# EasyEDA Pro project ProPrj_装配机器人（更新后）_2025-04-30.epro

# Schematic Schematic1
Board Name: Board1; Create Date: 2024-05-07; Page Name: P1; Project Name: 装配机器人（更新后）; Schematic Name: Schematic1; Update Date: 2025-04-26; Company: 嘉立创EDA; Page Size: A4; Version: V1.0
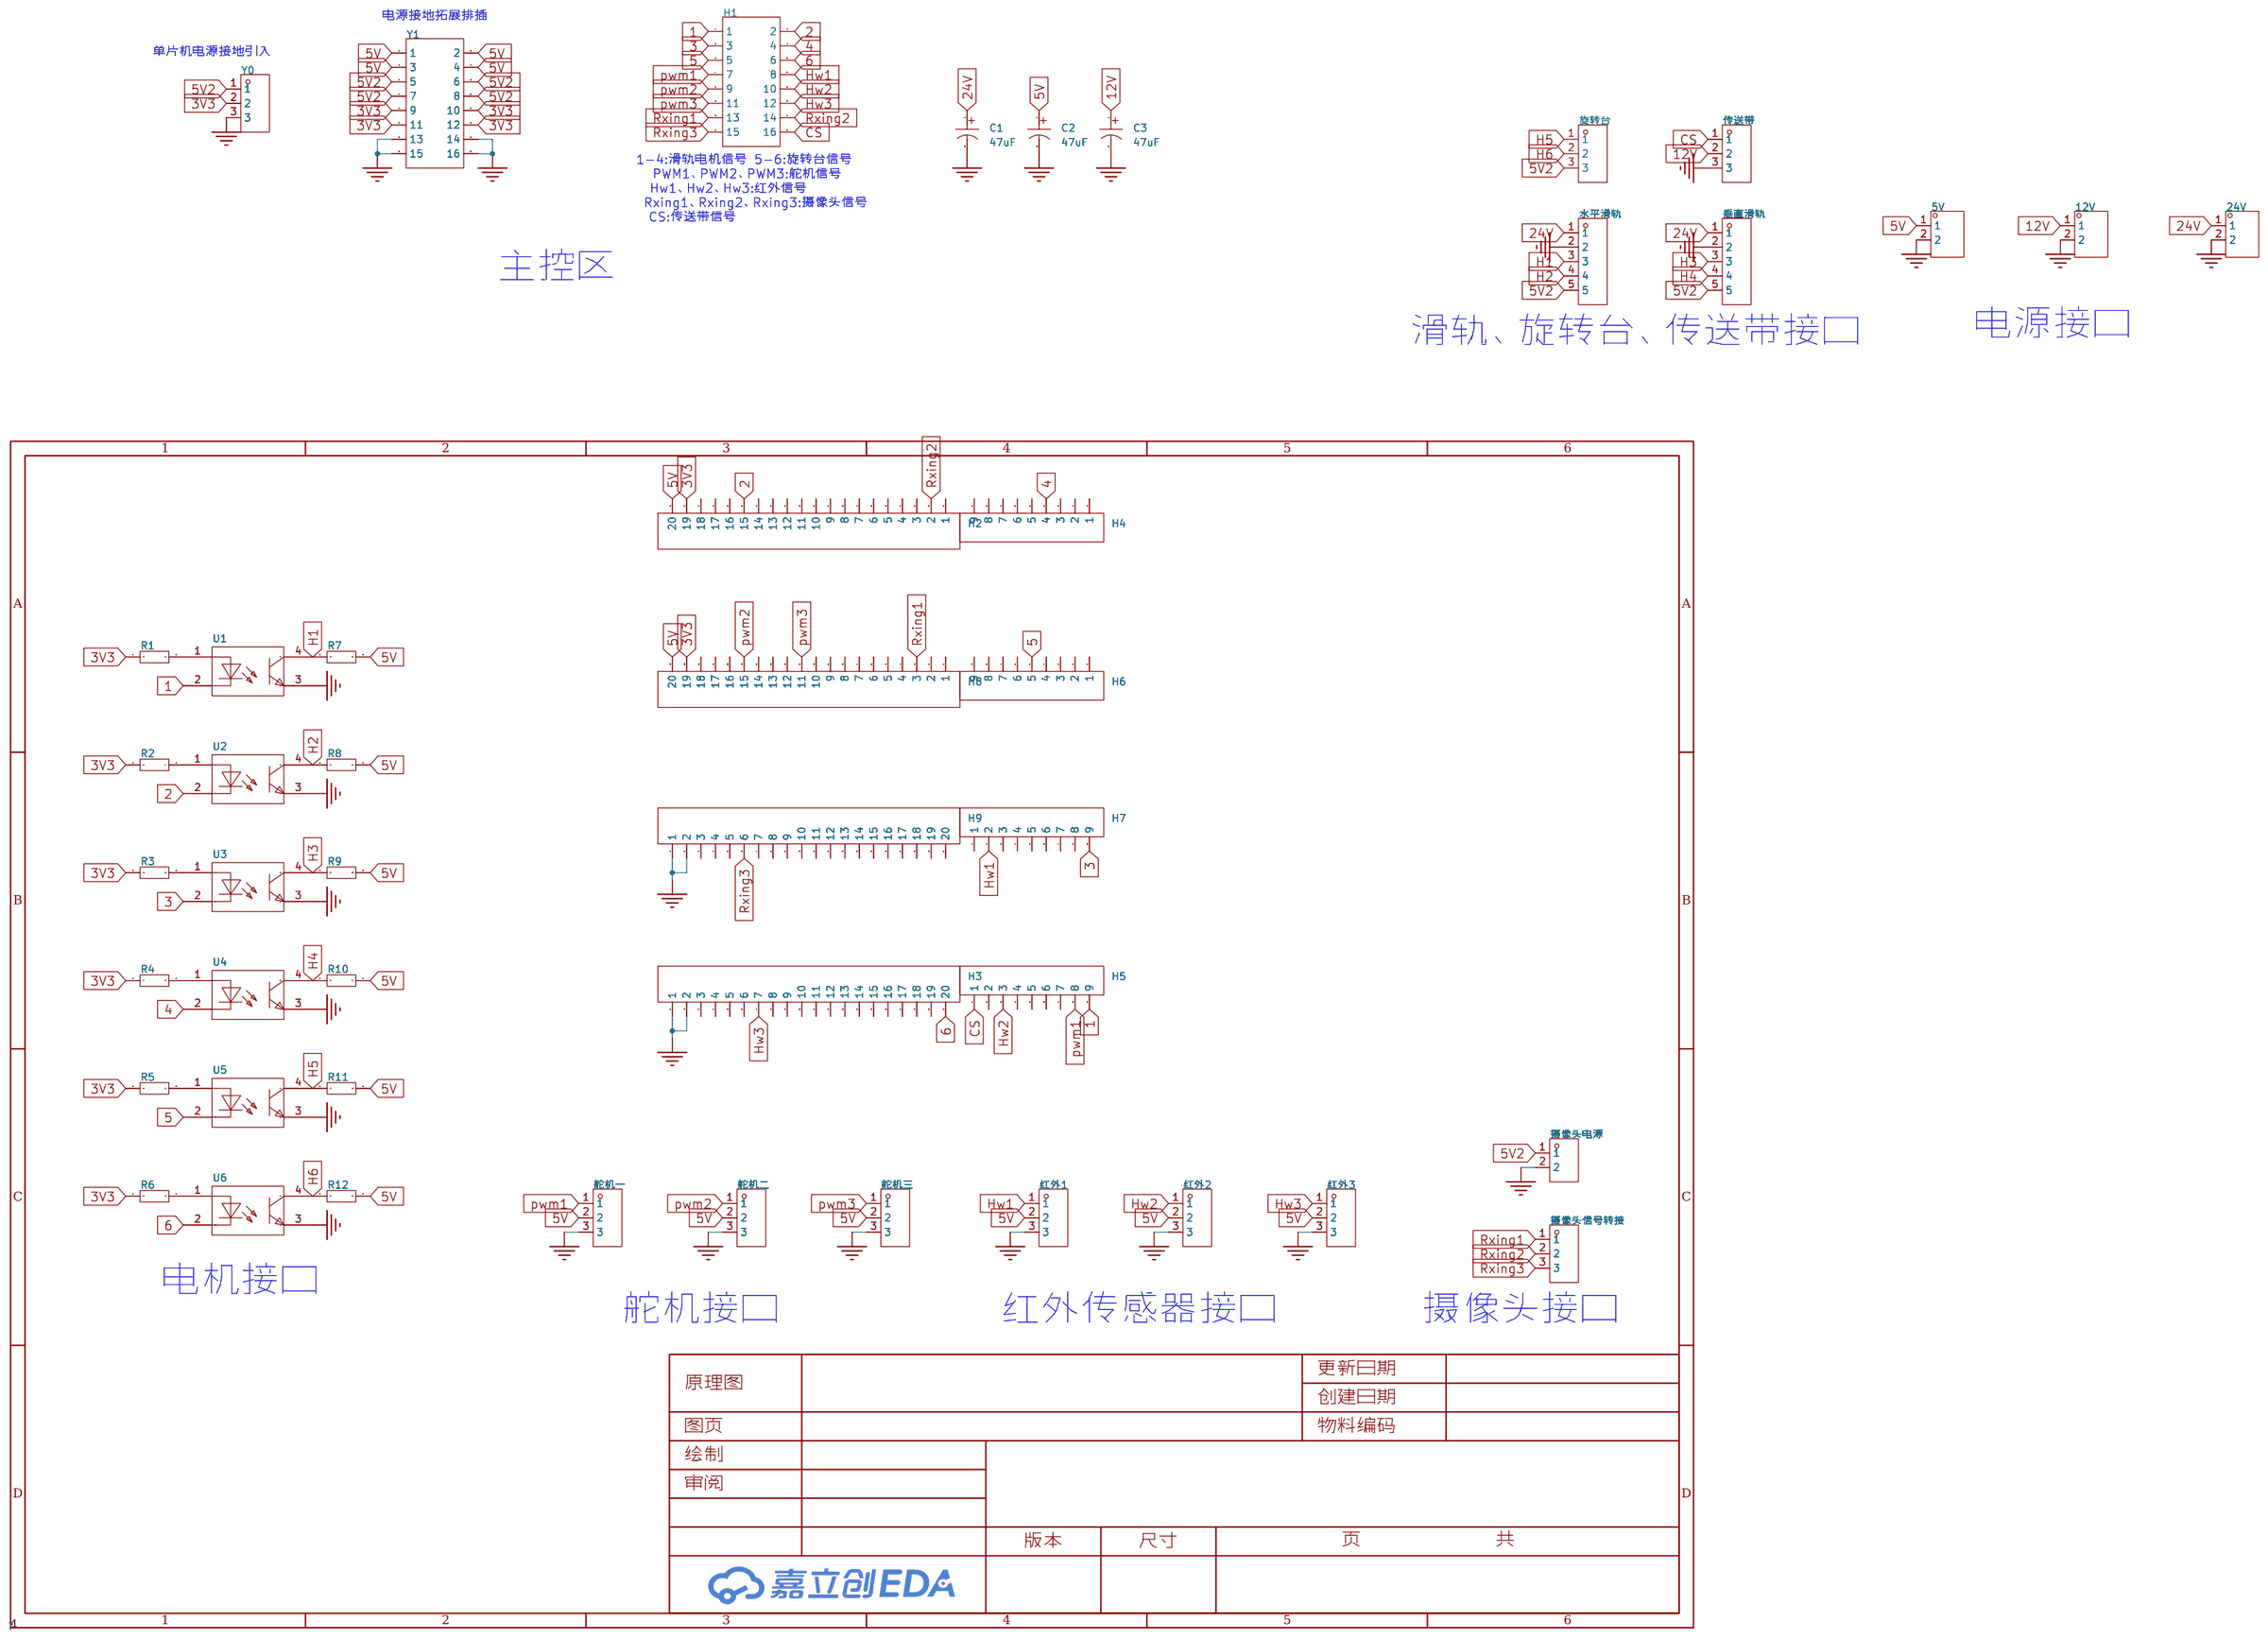
[diagram p0: schematic sheet]

## Parts
5V  WJ2EDGV-5.08-2P  [CONN-TH_WJ2EDGV-5.08-2P]
12V  WJ2EDGV-5.08-2P  [CONN-TH_WJ2EDGV-5.08-2P]
24V  WJ2EDGV-5.08-2P  [CONN-TH_WJ2EDGV-5.08-2P]
C1  47uF  [CAP-TH_BD5.0-P2.00-D0.8-FD]
C2  47uF  [CAP-TH_BD5.0-P2.00-D0.8-FD]
C3  47uF  [CAP-TH_BD5.0-P2.00-D0.8-FD]
H1  -  [HDR-TH_16P-P2.54-V-M-R2-C8-S2.54]
H2  -  [HDR-TH_20P-P2.54-V-F]
H3  -  [HDR-TH_20P-P2.54-V-F]
H4  -  [HDR-TH_9P-P2.54-V-F-1]
H5  -  [HDR-TH_9P-P2.54-V-F-1]
H6  -  [HDR-TH_9P-P2.54-V-F-1]
H7  -  [HDR-TH_9P-P2.54-V-F-1]
H8  -  [HDR-TH_20P-P2.54-V-F]
H9  -  [HDR-TH_20P-P2.54-V-F]
R1  10kΩ  [Res_1/4W]
R2  10kΩ  [Res_1/4W]
R3  10kΩ  [Res_1/4W]
R4  10kΩ  [Res_1/4W]
R5  10kΩ  [Res_1/4W]
R6  10kΩ  [Res_1/4W]
R7  10kΩ  [Res_1/4W]
R8  10kΩ  [Res_1/4W]
R9  10kΩ  [Res_1/4W]
R10  10kΩ  [Res_1/4W]
R11  10kΩ  [Res_1/4W]
R12  10kΩ  [Res_1/4W]
U1  CYTLP521-1(GB)  [DIP-4_L6.4-W4.6-P2.54-LS7.6-BL]
U2  CYTLP521-1(GB)  [DIP-4_L6.4-W4.6-P2.54-LS7.6-BL]
U3  CYTLP521-1(GB)  [DIP-4_L6.4-W4.6-P2.54-LS7.6-BL]
U4  CYTLP521-1(GB)  [DIP-4_L6.4-W4.6-P2.54-LS7.6-BL]
U5  CYTLP521-1(GB)  [DIP-4_L6.4-W4.6-P2.54-LS7.6-BL]
U6  CYTLP521-1(GB)  [DIP-4_L6.4-W4.6-P2.54-LS7.6-BL]
Y0  -  [HDR-TH_3P-P2.54-V-M]
Y1  -  [HDR-TH_16P-P2.54-V-M-R2-C8-S2.54]
传送带  DB2EV-5.08-3P-GN  [CONN-TH_3P-P5.08_DB2EV-5.08-3P]
垂直滑轨  XY2500V-C-5.08-5P  [CONN-TH_XY2500V-C-5.08-5P]
摄像头信号转接  HC-XHB-3A  [CONN-TH_3P-P2.50_HC-XHB-3AKK]
摄像头电源  ZX-XH2.54-2PZZ  [CONN-TH_2P-P2.50_HX25003-2A]
旋转台  DB2EV-5.08-3P-GN  [CONN-TH_3P-P5.08_DB2EV-5.08-3P]
水平滑轨  XY2500V-C-5.08-5P  [CONN-TH_XY2500V-C-5.08-5P]
红外1  HC-XHB-3A  [CONN-TH_3P-P2.50_HC-XHB-3AKK]
红外2  HC-XHB-3A  [CONN-TH_3P-P2.50_HC-XHB-3AKK]
红外3  HC-XHB-3A  [CONN-TH_3P-P2.50_HC-XHB-3AKK]
舵机一  HC-XHB-3A  [CONN-TH_3P-P2.50_HC-XHB-3AKK]
舵机三  HC-XHB-3A  [CONN-TH_3P-P2.50_HC-XHB-3AKK]
舵机二  HC-XHB-3A  [CONN-TH_3P-P2.50_HC-XHB-3AKK]

## Library data of the parts
5V 12V 24V = WJ2EDGV-5.08-2P: 连接器类型:板端/插座-开口;结构:1x2P;间距:5.08mm;颜色:绿色;安装方式:直针;排数:1;每排PIN数:2;; LCSC Part Name: 5.08mm 1x2P 排数:1 每排P数:2; Supplier Part: C8461; Manufacturer: KANGNEX(康奈克斯电气); Supplier Footprint: 插件,P=5.08mm; JLCPCB Part Class: 扩展库; Datasheet: https://atta.szlcsc.com/upload/public/pdf/source/20191225/C8461_177EB00EC60F9C1AD12B590D31C8666C.pdf; Supplier: LCSC; Connector Type: 板端/插座-开口; Structure: 1x2P; Pitch: 5.08mm; Color: 绿色; Mounting Style: 直针; Number of Pins: 2P; Number of Rows: 1; Number of PINs Per Row: 2
C1-C3 = KM226M050D11RR0VH2FP0: 容值:22uF;精度:±20%;额定电压:50V;纹波电流:79mA@120Hz;等效串联电阻:-;; LCSC Part Name: 22uF ±20% 50V; Supplier Part: C43346; Manufacturer: CX(承兴); Supplier Footprint: 插件,D5xL11mm; JLCPCB Part Class: 扩展库; Datasheet: https://atta.szlcsc.com/upload/public/pdf/source/20211027/06D6BA3719C264B639DC286D935D03EA.pdf; Supplier: LCSC; Tolerance: ±20%; Rated Voltage: 50V; Ripple Current: 79mA@120Hz; Lead Spacing: 2mm; φD: 5mm; L: 11mm; Lifetime @ Temp: 1000hrs@105℃
H1 Y1 = HDR-M_2.54_2x8: Supplier Part: C68234; Supplier Footprint: 插件,P=2.54mm
H2 H3 H8 H9 = HDR-F_2.54_1x20P: Supplier Part: C50984; Supplier Footprint: 插件
H4-H7 = HDR-F_2.54_1x9P: Supplier Part: C39576; Supplier Footprint: 插件
R1-R12 = Res_AXIAL-1/4W: Supplier Footprint: 轴向引线
U1-U6 = CYTLP521-1(GB): 输入电压类型:DC;正向电压:1.4V;输出电流:50mA;隔离电压(rms):5kV;反向电压:6V;接收端电压:80V;输出通道数:1;集射极饱和电压(Vce(sat)@Ic,IF):250mV@5mA,2mA;; LCSC Part Name: DC输入 隔离电压(rms):5000V; Supplier Part: C385051; Manufacturer: OCIC(卓睿科); Supplier Footprint: DIP-4; JLCPCB Part Class: 扩展库; Datasheet: https://atta.szlcsc.com/upload/public/pdf/source/20190506/C385051_7901CCBB52669F8EFFA70B18D166A733.pdf; Supplier: LCSC; Input voltage type: DC; Output Type: 光电三极管; Forward Voltage: 1.4V; Output Current: 50mA; Isolation Voltage(rms): 5kV; Reverse Voltage: 6V; Receiving End Voltage: 80V; Number of Outputs: 1; Collector-Emitter Saturation Voltage (Vce(sat)@Ic,IF): 250mV@5mA,2mA; Rise time: 2us@2mA,100Ω; Fall time: 3us@2mA,100Ω; Operating Temperature: -55℃~+110℃
Y0 = HDR-M_2.54_1x3P: Supplier Part: C2937625; Supplier Footprint: 插件
传送带 旋转台 = DB2EV-5.08-3P-GN: 连接器类型:板端/插座-开口;结构:1x3P;间距:5.08mm;颜色:绿色;安装方式:直针;排数:1;每排PIN数:3;额定电流:20A;额定电压:320V;工作温度范围:-40℃~+105℃;; LCSC Part Name: 5.08mm 1x3P 排数:1 每排P数:3; Supplier Part: C395742; Manufacturer: DORABO(地博电气); Supplier Footprint: 插件,P=5.08mm; JLCPCB Part Class: 扩展库; Datasheet: https://atta.szlcsc.com/upload/public/pdf/source/20230327/C7F5C29E43513DD7F373BAE50F9F908A.pdf; Supplier: LCSC; Connector Type: 板端/插座-开口; Structure: 1x3P; Pitch: 5.08mm; Color: 绿色; Mounting Style: 直针; Number of Pins: 3P; Number of Rows: 1; Number of PINs Per Row: 3; Current Rating (Max): 20A; Voltage Rating (Max): 320V; Operating Temperature Range: -40℃~+105℃
垂直滑轨 水平滑轨 = XY2500V-C-5.08-5P: 连接器类型:板端/插座-开口;结构:1x5P;间距:5.08mm;颜色:绿色;安装方式:直针;排数:1;每排PIN数:5;额定电流:15A;额定电压:300V;工作温度范围:-;; LCSC Part Name: 5.08mm 1x5P 排数:1 每排P数:5; Supplier Part: C505773; Manufacturer: XINLAIYA(新莱亚); Supplier Footprint: 插件,P=5.08mm; JLCPCB Part Class: 扩展库; Datasheet: https://atta.szlcsc.com/upload/public/pdf/source/20200331/C505762_203BBA30CC567BF272D649DCBBD7E810.pdf; Supplier: LCSC; Connector Type: 板端/插座-开口; Structure: 1x5P; Pitch: 5.08mm; Color: 绿色; Mounting Style: 直针; Number of Pins: 5P; Number of Rows: 1; Number of PINs Per Row: 5; Current Rating (Max): 15A; Voltage Rating (Max): 300V
摄像头信号转接 红外1-红外3 舵机一 舵机三 舵机二 = HC-XHB-3A: 插针结构:1x3P;间距:2.5mm;安装方式:直插;总PIN数:3P;排数:1;每排PIN数:3;行距:-;额定电流:3A;触头材质:黄铜;触头镀层:锡;工作温度范围:-25℃~+85℃;; LCSC Part Name: 1x3P 间距:2.5mm 直插; Supplier Part: C3011963; Manufacturer: HCTL(华灿天禄); Supplier Footprint: 插件,P=2.5mm; JLCPCB Part Class: 扩展库; Datasheet: https://atta.szlcsc.com/upload/public/pdf/source/20230711/94C5BFB4D0A0F292EDF07DDE5BFB6378.pdf; Supplier: LCSC; Pins Structure: 1x3P; Pitch: 2.5mm; Mounting Style: 直插; Number of Pins: 3P; Number of Rows: 1; Number of PINs Per Row: 3; Current Rating (Max): 3A; Contact Material: 黄铜; Contact Plating: 锡; Operating Temperature Range: -25℃~+85℃
摄像头电源 = ZX-XH2.54-2PZZ: 插针结构:1x2P;间距:2.54mm;安装方式:直插;参考系列:XH;总PIN数:2P;排数:1;每排PIN数:2;行距:-;额定电流:3A;触头材质:黄铜;触头镀层:锡;工作温度范围:-25℃~+85℃;; Supplier Part: C7429632; Manufacturer: Megastar(兆星); Supplier Footprint: 插件,P=2.54mm; JLCPCB Part Class: 扩展库; Datasheet: https://atta.szlcsc.com/upload/public/pdf/source/20230619/19BA6947230AA44A04D3EDD65E618FD0.pdf; Supplier: LCSC; Pins Structure: 1x2P; Pitch: 2.54mm; Mounting Style: 直插; Reference Series: XH; Number of Pins: 2P; Number of Rows: 1; Number of PINs Per Row: 2; Current Rating (Max): 3A; Contact Material: 黄铜; Contact Plating: 锡; Operating Temperature Range: -25℃~+85℃

## Nets
3V3: H2.19 H8.19 R1.1 R2.1 R3.1 R4.1 R5.1 R6.1 Y0.2 Y1.9 Y1.10 Y1.11 Y1.12
5V: 5V.1 C2.1 H2.20 H8.20 R7.2 R8.2 R9.2 R10.2 R11.2 R12.2 Y1.1 Y1.2 Y1.3 Y1.4 红外1.2 红外2.2 红外3.2 舵机一.2 舵机三.2 舵机二.2
5V2: Y0.1 Y1.5 Y1.6 Y1.7 Y1.8 垂直滑轨.5 摄像头电源.1 旋转台.3 水平滑轨.5
12V: 12V.1 C3.1 传送带.2
24V: 24V.1 C1.1 垂直滑轨.1 水平滑轨.1
GND: 5V.2 12V.2 24V.2 C1.2 C2.2 C3.2 H3.1 H3.2 H9.1 H9.2 U1.3(EMI) U2.3(EMI) U3.3(EMI) U4.3(EMI) U5.3(EMI) U6.3(EMI) Y0.3 Y1.13 Y1.14 Y1.15 Y1.16 传送带.3 垂直滑轨.2 摄像头电源.2 水平滑轨.2 红外1.3 红外2.3 红外3.3 舵机一.3 舵机三.3 舵机二.3
1: H1.1 H5.9 U1.2(CAT)
2: H1.2 H2.15 U2.2(CAT)
3: H1.3 H7.9 U3.2(CAT)
4: H1.4 H4.4 U4.2(CAT)
5: H1.5 H6.5 U5.2(CAT)
6: H1.6 H3.20 U6.2(CAT)
CS: H1.16 H5.1 传送带.1
H1: R7.1 U1.4(COL) 水平滑轨.3
H2: R8.1 U2.4(COL) 水平滑轨.4
H3: R9.1 U3.4(COL) 垂直滑轨.3
H4: R10.1 U4.4(COL) 垂直滑轨.4
H5: R11.1 U5.4(COL) 旋转台.1
H6: R12.1 U6.4(COL) 旋转台.2
Hw1: H1.8 H7.2 红外1.1
Hw2: H1.10 H5.3 红外2.1
Hw3: H1.12 H3.7 红外3.1
pwm1: H1.7 H5.8 舵机一.1
pwm2: H1.9 H8.15 舵机二.1
pwm3: H1.11 H8.11 舵机三.1
Rxing1: H1.13 H8.3 摄像头信号转接.1
Rxing2: H1.14 H2.2 摄像头信号转接.2
Rxing3: H1.15 H9.6 摄像头信号转接.3
$1N2300: R4.2 U4.1(AN)
$1N4756: R1.2 U1.1(AN)
$1N4785: R2.2 U2.1(AN)
$1N4814: R3.2 U3.1(AN)
$1N6717: R5.2 U5.1(AN)
$1N6755: R6.2 U6.1(AN)

Not connected (* = marked no-connect by the designer): H2 1 3 4 5 6 7 8 9 10 11 12 13 14 16 17 18; H3 3 4 5 6 8 9 10 11 12 13 14 15 16 17 18 19; H4 1 2 3 5 6 7 8 9; H5 2 4 5 6 7; H6 1 2 3 4 6 7 8 9; H7 1 3 4 5 6 7 8; H8 1 2 4 5 6 7 8 9 10 12 13 14 16 17 18; H9 3 4 5 7 8 9 10 11 12 13 14 15 16 17 18 19 20

## Notes on the sheet
- 电源接地拓展排插
- 单片机电源接地引入
- 1-4:滑轨电机信号 5-6:旋转台信号
- PWM1、PWM2、PWM3:舵机信号
- Hw1、Hw2、Hw3:红外信号
- Rxing1、Rxing2、Rxing3:摄像头信号
- CS:传送带信号
- 主控区
- 滑轨、旋转台、传送带接口
- 电源接口
- 电机接口
- 舵机接口
- 红外传感器接口
- 摄像头接口

# Board PCB1
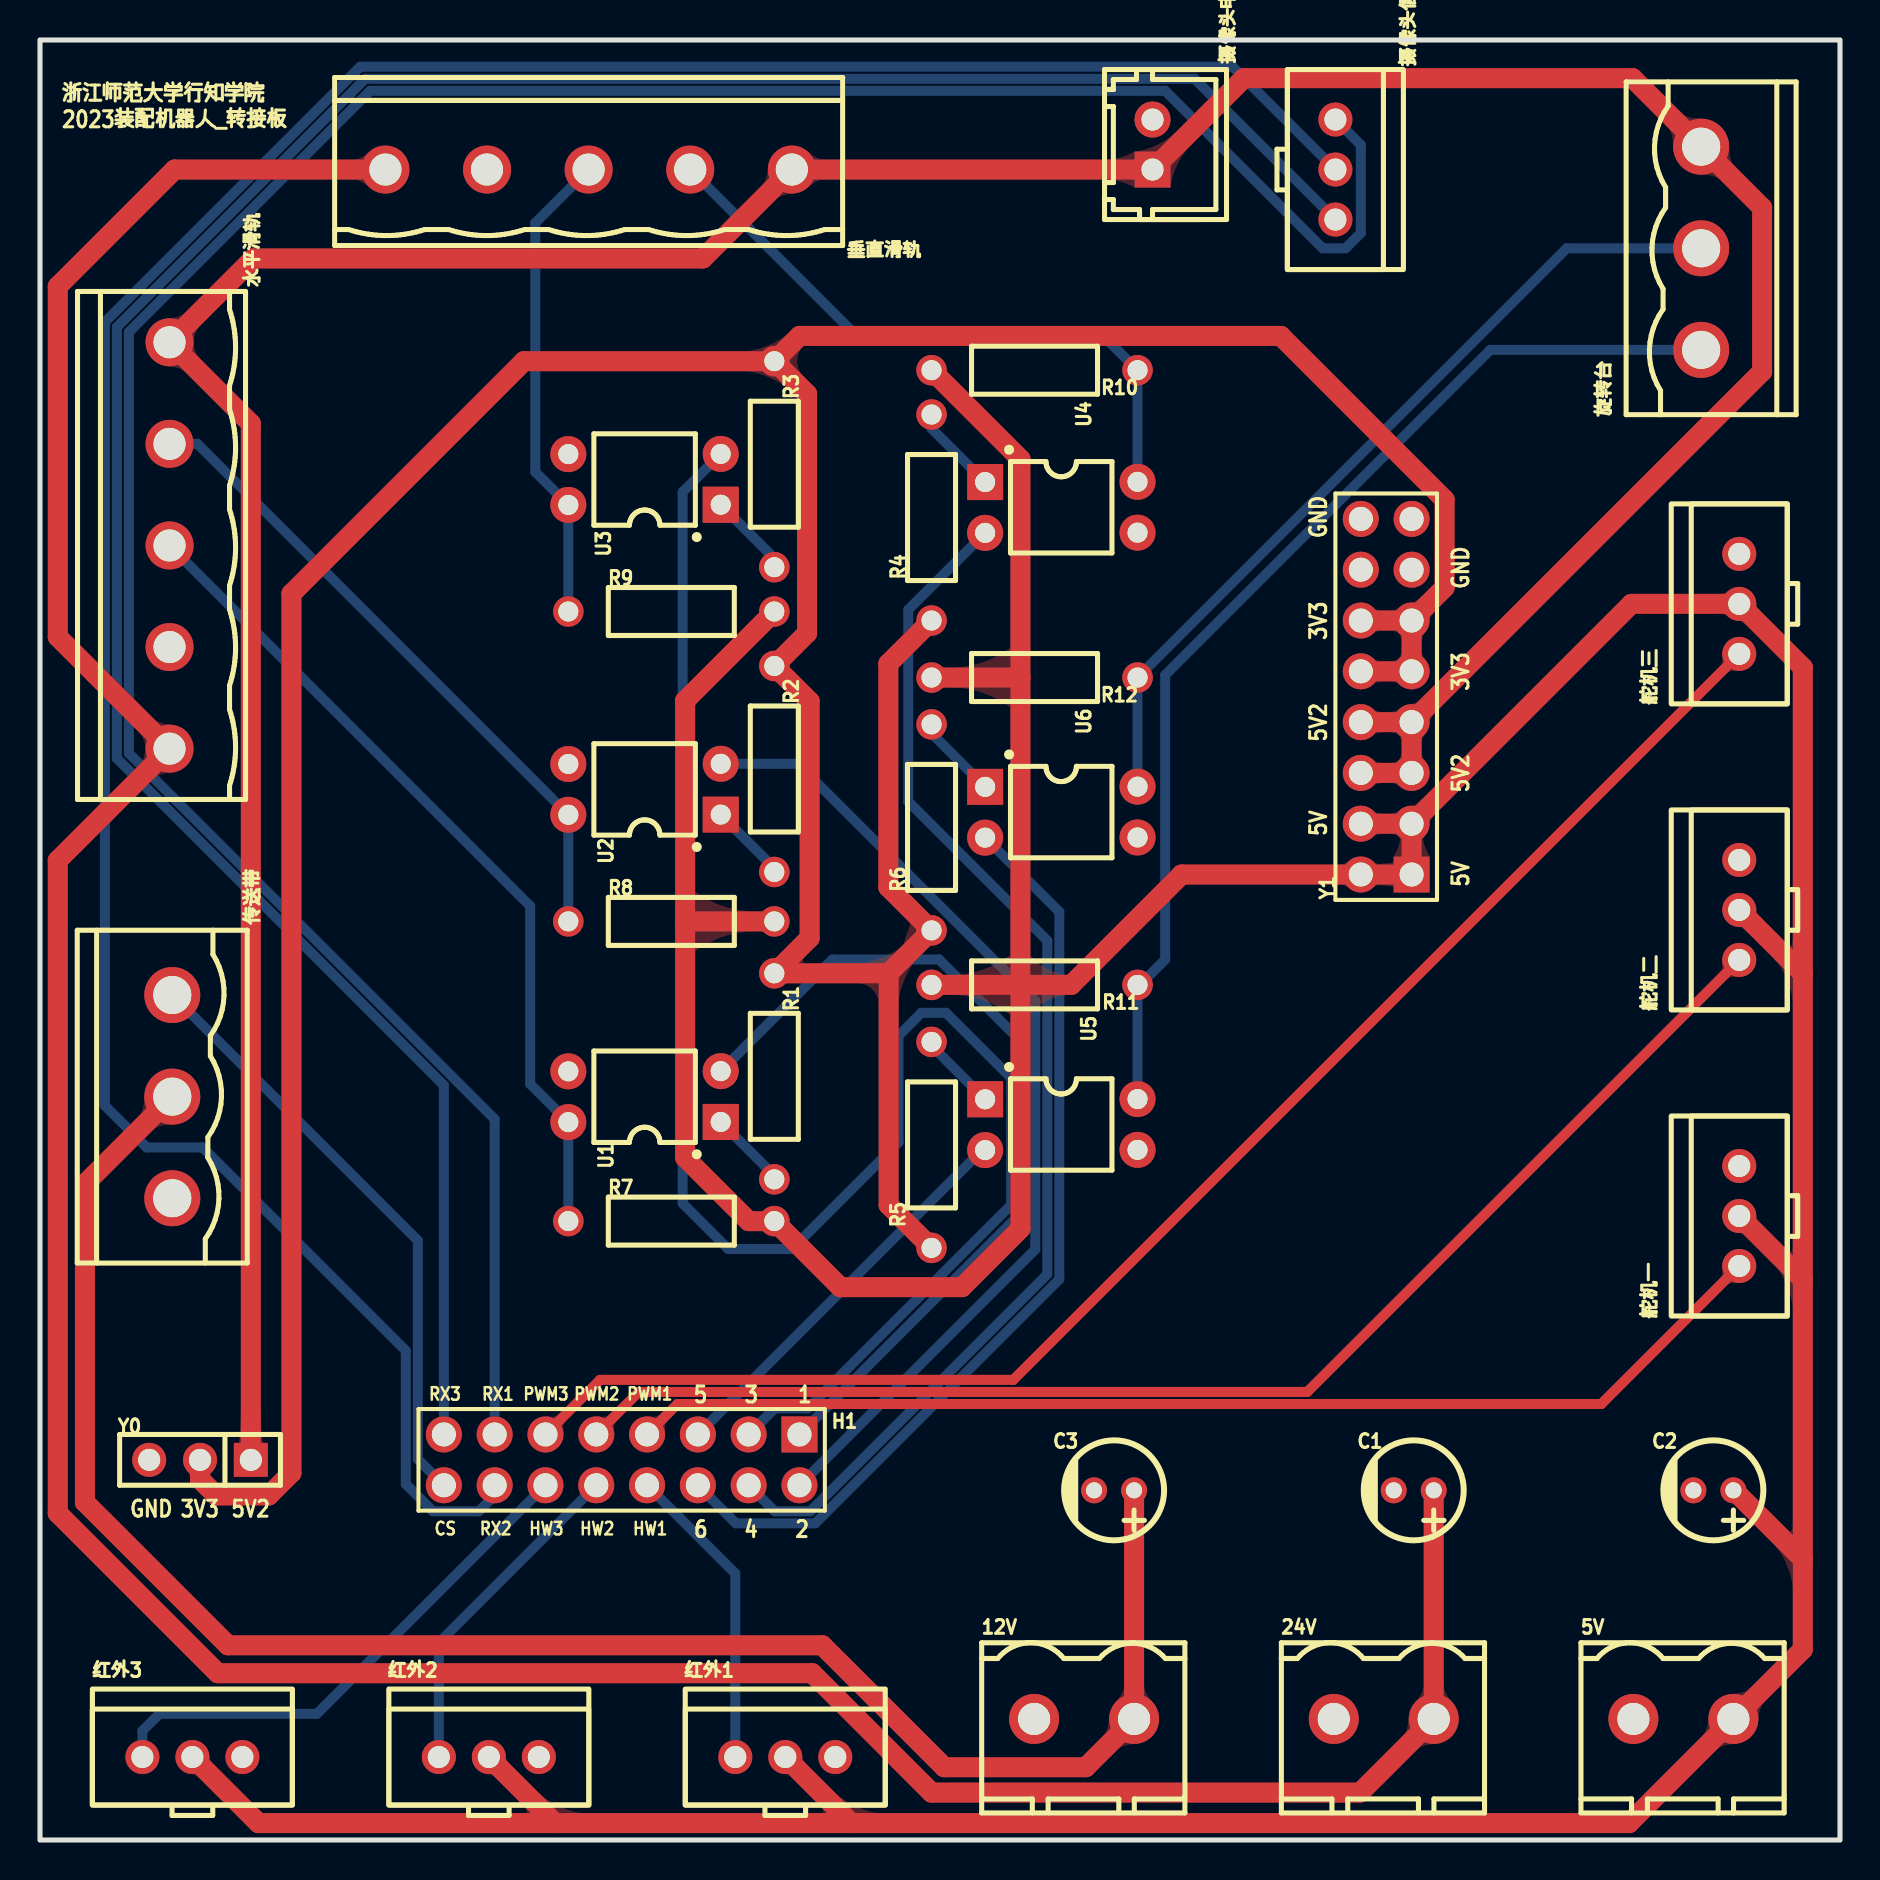
[diagram p1: board, top side]
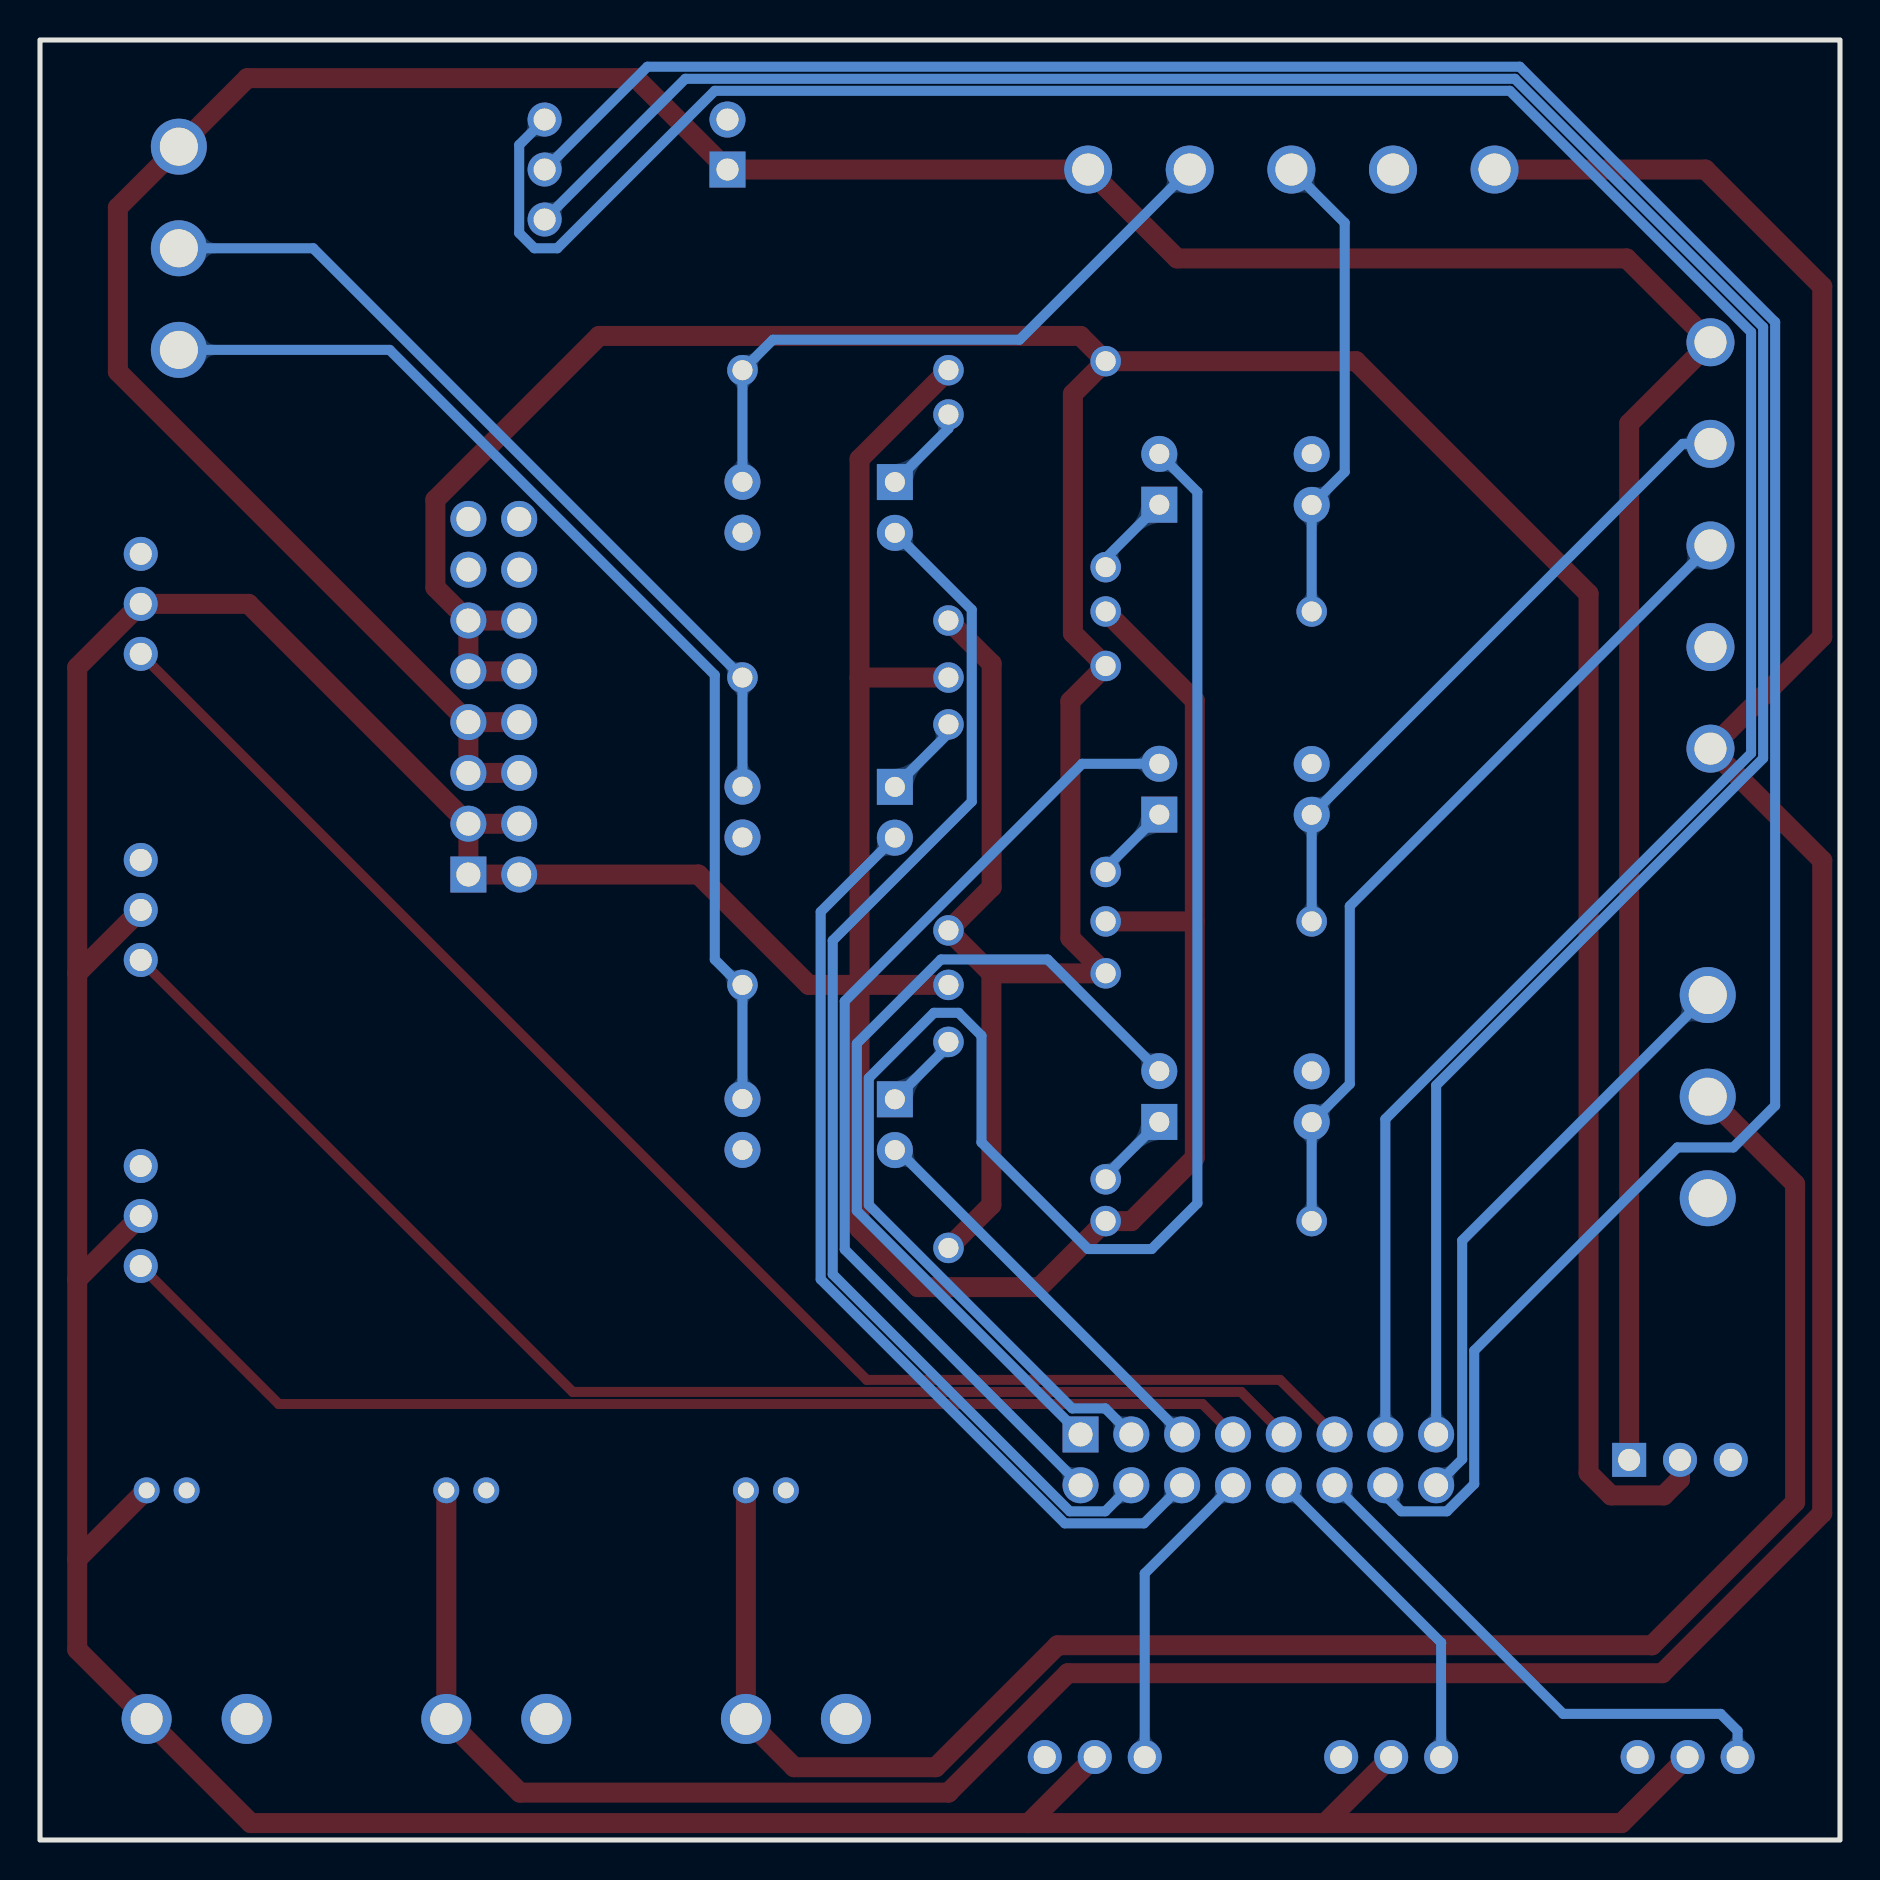
[diagram p2: board, bottom side, seen from below]

Outline 90 x 90 mm; copper layers: Top Layer, Bottom Layer. Coordinates in mm from the lower left corner of the outline.
Outline path: rectangle 0,90 90,0
Stack: Top Layer 0.035mm / Dielectric1 1.51mm FR4 er 4.5 / Bottom Layer 0.035mm

## Design rules (mm)
template: 自定义配置
spacing copperThickness1oz (default): track to track 0.102, other pairs 0.152 to 0.3
spacing copperThickness2oz: track to track 0.203, other pairs 0.152 to 0.3
track width copperThickness1oz (default): min 0.127, default 0.254, max 2.54
track width copperThickness2oz: min 0.203, default 0.254, max 2.54
differential pair differentialPair (default): width min 0.127, default 0.254, max 2.54; gap min 0.152, default 0.152
via viaSize (default): diameter min 0.5, default 0.61, max 10; hole min 0.3, default 0.305, max 6.3

## Placement (name value [footprint] x y rotation side)
5V  WJ2EDGV-5.08-2P  [CONN-TH_WJ2EDGV-5.08-2P]  82.17 6.05 180 top
12V  WJ2EDGV-5.08-2P  [CONN-TH_WJ2EDGV-5.08-2P]  52.21 6.05 180 top
24V  WJ2EDGV-5.08-2P  [CONN-TH_WJ2EDGV-5.08-2P]  67.19 6.05 180 top
C1  47uF  [CAP-TH_BD5.0-P2.00-D0.8-FD]  68.69 17.48 180 top
C2  47uF  [CAP-TH_BD5.0-P2.00-D0.8-FD]  83.67 17.48 180 top
C3  47uF  [CAP-TH_BD5.0-P2.00-D0.8-FD]  53.71 17.48 180 top
H1  -  [HDR-TH_16P-P2.54-V-M-R2-C8-S2.54]  29.08 19.01 180 top
R1  10kΩ  [Res_1/4W]  36.72 38.18 270 top
R2  10kΩ  [Res_1/4W]  36.72 53.55 270 top
R3  10kΩ  [Res_1/4W]  36.72 68.79 270 top
R4  10kΩ  [Res_1/4W]  44.58 66.12 90 top
R5  10kΩ  [Res_1/4W]  44.58 34.75 90 top
R6  10kΩ  [Res_1/4W]  44.58 50.63 90 top
R7  10kΩ  [Res_1/4W]  31.57 30.94 0 top
R8  10kΩ  [Res_1/4W]  31.57 45.93 0 top
R9  10kΩ  [Res_1/4W]  31.57 61.42 0 top
R10  10kΩ  [Res_1/4W]  49.73 73.49 180 top
R11  10kΩ  [Res_1/4W]  49.73 42.76 180 top
R12  10kΩ  [Res_1/4W]  49.73 58.12 180 top
U1  CYTLP521-1(GB)  [DIP-4_L6.4-W4.6-P2.54-LS7.6-BL]  30.23 37.17 90 top
U2  CYTLP521-1(GB)  [DIP-4_L6.4-W4.6-P2.54-LS7.6-BL]  30.23 52.53 90 top
U3  CYTLP521-1(GB)  [DIP-4_L6.4-W4.6-P2.54-LS7.6-BL]  30.23 68.03 90 top
U4  CYTLP521-1(GB)  [DIP-4_L6.4-W4.6-P2.54-LS7.6-BL]  51.07 66.63 270 top
U5  CYTLP521-1(GB)  [DIP-4_L6.4-W4.6-P2.54-LS7.6-BL]  51.07 35.77 270 top
U6  CYTLP521-1(GB)  [DIP-4_L6.4-W4.6-P2.54-LS7.6-BL]  51.07 51.39 270 top
Y0  -  [HDR-TH_3P-P2.54-V-M]  8 19.01 180 top
Y1  -  [HDR-TH_16P-P2.54-V-M-R2-C8-S2.54]  67.31 57.16 90 top
传送带  DB2EV-5.08-3P-GN  [CONN-TH_3P-P5.08_DB2EV-5.08-3P]  6.61 37.17 270 top
垂直滑轨  XY2500V-C-5.08-5P  [CONN-TH_XY2500V-C-5.08-5P]  27.43 83.52 0 top
摄像头信号转接  HC-XHB-3A  [CONN-TH_3P-P2.50_HC-XHB-3AKK]  64.77 83.52 270 top
摄像头电源  ZX-XH2.54-2PZZ  [CONN-TH_2P-P2.50_HX25003-2A]  55.63 84.77 90 top
旋转台  DB2EV-5.08-3P-GN  [CONN-TH_3P-P5.08_DB2EV-5.08-3P]  83.06 79.59 90 top
水平滑轨  XY2500V-C-5.08-5P  [CONN-TH_XY2500V-C-5.08-5P]  6.48 64.73 90 top
红外1  HC-XHB-3A  [CONN-TH_3P-P2.50_HC-XHB-3AKK]  37.26 4.15 0 top
红外2  HC-XHB-3A  [CONN-TH_3P-P2.50_HC-XHB-3AKK]  22.44 4.15 0 top
红外3  HC-XHB-3A  [CONN-TH_3P-P2.50_HC-XHB-3AKK]  7.62 4.15 0 top
舵机一  HC-XHB-3A  [CONN-TH_3P-P2.50_HC-XHB-3AKK]  84.96 31.2 90 top
舵机三  HC-XHB-3A  [CONN-TH_3P-P2.50_HC-XHB-3AKK]  84.96 61.81 90 top
舵机二  HC-XHB-3A  [CONN-TH_3P-P2.50_HC-XHB-3AKK]  84.96 46.5 90 top

## Footprints (pads in the part's own frame, mm; a bottom-side part is the same pattern mirrored in y, then rotated)
CAP-TH_BD5.0-P2.00-D0.8-FD
  round 1.3 hole 0.8: 1(-1,0) 2(1,0)
CONN-TH_2P-P2.50_HX25003-2A
  rect 1.8x1.8 hole 1.1: 1(-1.25,0)
  round 1.8 hole 1.1: 2(1.25,0)
CONN-TH_3P-P2.50_HC-XHB-3AKK
  round 1.7 hole 1.1: 1(-2.5,0) 2(0,0) 3(2.5,0)
CONN-TH_3P-P5.08_DB2EV-5.08-3P
  round 2.8 hole 1.9: 1(-5.08,0) 2(0,0) 3(5.08,0)
CONN-TH_WJ2EDGV-5.08-2P
  round 2.5 hole 1.6: 1(-2.499,0) 2(2.499,0)
CONN-TH_XY2500V-C-5.08-5P
  round 2.4 hole 1.6: 1(-10.16,0) 2(-5.08,0) 3(0,0) 4(5.08,0) 5(10.16,0)
DIP-4_L6.4-W4.6-P2.54-LS7.6-BL
  rect 1.8x1.8 hole 1: 1(-1.265,-3.81)
  round 1.8 hole 1: 2(1.275,-3.81) 3(1.265,3.81) 4(-1.275,3.81)
HDR-TH_3P-P2.54-V-M
  rect 1.7x1.7 hole 1.1: 1(-2.54,0)
  round 1.7 hole 1.1: 2(0,0) 3(2.54,0)
HDR-TH_16P-P2.54-V-M-R2-C8-S2.54
  rect 1.8x1.8 hole 1.2: 1(-8.89,-1.27)
  round 1.8 hole 1.2: 2(-8.89,1.27) 3(-6.35,-1.27) 4(-6.35,1.27) 5(-3.81,-1.27) 6(-3.81,1.27) 7(-1.27,-1.27) 8(-1.27,1.27) 9(1.27,-1.27) 10(1.27,1.27) 11(3.81,-1.27) 12(3.81,1.27) 13(6.35,-1.27) 14(6.35,1.27) 15(8.89,-1.27) 16(8.89,1.27)
Res_1/4W
  round 1.524 hole 1: 1(-5.15,0) 2(5.15,0)

## Nets
3V3: R1.1 R2.1 R3.1 R4.1 R5.1 R6.1 Y0.2 Y1.9 Y1.10 Y1.11 Y1.12
5V: 5V.1 C2.1 R7.2 R8.2 R9.2 R10.2 R11.2 R12.2 Y1.1 Y1.2 Y1.3 Y1.4 红外1.2 红外2.2 红外3.2 舵机一.2 舵机三.2 舵机二.2
5V2: Y0.1 Y1.5 Y1.6 Y1.7 Y1.8 垂直滑轨.5 摄像头电源.1 旋转台.3 水平滑轨.5
12V: 12V.1 C3.1 传送带.2
24V: 24V.1 C1.1 垂直滑轨.1 水平滑轨.1
GND: 5V.2 12V.2 24V.2 C1.2 C2.2 C3.2 U1.3 U2.3 U3.3 U4.3 U5.3 U6.3 Y0.3 Y1.13 Y1.14 Y1.15 Y1.16 传送带.3 垂直滑轨.2 摄像头电源.2 水平滑轨.2 红外1.3 红外2.3 红外3.3 舵机一.3 舵机三.3 舵机二.3
1: H1.1 U1.2
2: H1.2 U2.2
3: H1.3 U3.2
4: H1.4 U4.2
5: H1.5 U5.2
6: H1.6 U6.2
CS: H1.16 传送带.1
H1: R7.1 U1.4 水平滑轨.3
H2: R8.1 U2.4 水平滑轨.4
H3: R9.1 U3.4 垂直滑轨.3
H4: R10.1 U4.4 垂直滑轨.4
H5: R11.1 U5.4 旋转台.1
H6: R12.1 U6.4 旋转台.2
HW1: H1.8 红外1.1
HW2: H1.10 红外2.1
HW3: H1.12 红外3.1
PWM1: H1.7 舵机一.1
PWM2: H1.9 舵机二.1
PWM3: H1.11 舵机三.1
RXING1: H1.13 摄像头信号转接.1
RXING2: H1.14 摄像头信号转接.2
RXING3: H1.15 摄像头信号转接.3
$1N2300: R4.2 U4.1
$1N4756: R1.2 U1.1
$1N4785: R2.2 U2.1
$1N4814: R3.2 U3.1
$1N6717: R5.2 U5.1
$1N6755: R6.2 U6.1

## Routing (per net, layer and track width the routed paths; a pad name or vN(x,y) marks a point on that pad's centre or on a via; arc(x,y) is an arc through that point)
3V3: length 205.1
  Top Layer w1: Y1.10 Y1.9 Y1.11 ; R4.1 42.42,58.81 42.42,47.64 R6.1 42.43,43.33 ; 42.43,43.33 42.43,31.75 R5.1 ; 42.43,43.33 36.72,43.33 38.48,45.1 38.48,56.94 R2.1 38.35,60.34 38.35,72.3 R3.1 ; Y0.2 8,18.04 8.81,17.23 11.45,17.23 12.57,18.36 12.57,62.31 24.2,73.94 R3.1 ; Y1.11 70.23,62.62 70.23,67.01 62.04,75.2 37.98,75.2 R3.1 ; Y1.11 Y1.12
5V: length 318.1
  Top Layer w1: 25.74,0.85 40.57,0.85 ; 25.74,0.85 红外2.2 ; 25.74,0.85 10.92,0.85 红外3.2 ; 40.57,0.85 79.46,0.85 5V.1 88.14,9.52 88.14,14.04 ; 40.57,0.85 红外1.2 ; 32.26,45.93 32.26,34.12 35.43,30.94 R7.2 40.02,27.64 46.1,27.64 49.02,30.56 49.02,42.76 ; 32.26,45.93 32.26,56.97 R9.2 ; 32.26,45.93 R8.2 ; R10.2 49.02,69.04 49.02,58.12 ; Y1.3 Y1.1 Y1.2 57.08,48.27 51.56,42.76 49.02,42.76 ; Y1.3 Y1.4 ; Y1.3 79.57,61.81 舵机三.2 88.14,58.63 88.14,43.33 ; 舵机一.2 88.14,28.02 ; 88.14,28.02 88.14,43.33 ; 88.14,28.02 88.14,14.04 ; 49.02,42.76 R11.2 ; 49.02,42.76 49.02,58.12 ; 88.14,43.33 舵机二.2 ; R12.2 49.02,58.12 ; 88.14,14.04 84.67,17.51
5V2: length 185.9
  Top Layer w1: 10.54,19.01 10.54,70.82 水平滑轨.5 10.67,79.08 33.15,79.08 垂直滑轨.5 摄像头电源.1 60.2,88.09 79.63,88.09 86.11,81.62 86.11,73.42 Y1.7 ; Y1.7 Y1.5 Y1.6 ; Y1.7 Y1.8
12V: length 92.5
  Top Layer w1: 传送带.2 2.25,32.8 2.25,16.89 9.4,9.74 39.12,9.74 45.21,3.64 52.29,3.64 12V.1 54.71,17.51
24V: length 172.3
  Top Layer w1: 垂直滑轨.1 6.73,83.52 0.89,77.68 0.89,60.15 水平滑轨.1 0.89,48.98 0.89,16.34 8.89,8.34 38.61,8.34 44.58,2.37 66,2.37 69.69,6.05 69.69,17.51
1: length 43.4
  Bottom Layer w0.5: U1.2 39.62,44.03 44.95,44.03 49.16,39.82 49.16,31.47 ; 49.16,31.47 H1.1
2: length 49.7
  Bottom Layer w0.5: H1.2 49.76,29.53 49.76,41.94 37.89,53.81 34.04,53.81
3: length 89.2
  Bottom Layer w0.5: U3.2 32.13,67.4 32.13,31.83 34.42,29.55 37.59,29.55 42.93,34.88 42.93,40.22 44.07,41.36 45.3,41.36 48.56,38.1 48.56,31.75 38.39,21.58 36.74,21.58 H1.3
4: length 61.9
  Bottom Layer w0.5: H1.4 36.74,16.43 38.51,16.43 50.36,28.29 50.36,44.97 43.41,51.92 43.41,61.51 U4.2
5: length 20.3
  Bottom Layer w0.5: 47.26,34.5 47.11,34.5 H1.5
6: length 47.5
  Bottom Layer w0.5: H1.6 34.8,15.83 38.76,15.83 50.97,28.04 50.97,46.41 U6.2
CS: length 30.1
  Bottom Layer w0.5: 传送带.1 18.89,29.97 18.89,19.04 H1.16
H1: length 42
  Bottom Layer w0.5: R7.1 U1.4 24.51,37.8 24.51,46.69 水平滑轨.3
H2: length 33
  Bottom Layer w0.5: R8.1 U2.4 7.87,69.81 水平滑轨.4
H3: length 23.9
  Bottom Layer w0.5: R9.1 U3.4 24.77,68.4 24.77,80.86 垂直滑轨.3
H4: length 32.1
  Bottom Layer w0.5: 垂直滑轨.4 41.02,75.01 53.35,75.01 R10.1 U4.4
H5: length 55.4
  Bottom Layer w0.5: U5.4 R11.1 54.99,42.76 56.26,44.03 56.26,58.25 72.52,74.51 旋转台.1
H6: length 42.5
  Bottom Layer w0.5: U6.4 R12.1 76.34,79.59 旋转台.2
HW1: length 15.4
  Bottom Layer w0.5: H1.8 34.76,13.33 红外1.1
HW2: length 16.8
  Bottom Layer w0.5: 红外2.1 19.94,9.87 H1.10
HW3: length 26.5
  Bottom Layer w0.5: 红外3.1 5.12,5.46 5.97,6.31 13.84,6.31 H1.12
PWM1: length 58.1
  Top Layer w0.5: H1.7 31.88,21.8 78.06,21.8 舵机一.1
PWM2: length 67
  Top Layer w0.5: 舵机二.1 63.36,22.4 29.94,22.4 H1.9
PWM3: length 75.9
  Top Layer w0.5: H1.11 28,23 48.66,23 舵机三.1
RXING1: length 139.1
  Bottom Layer w0.5: H1.13 22.73,36.04 4.44,54.33 4.44,75.39 16.51,87.46 56.26,87.46 64.13,79.59 65.28,79.59 66.04,80.35 66.04,84.75 摄像头信号转接.1
RXING2: length 140.8
  Bottom Layer w0.5: H1.14 22.73,17.23 21.94,16.43 19.65,16.43 18.29,17.8 18.29,24.47 8.13,34.63 5.33,34.63 3.24,36.72 3.24,75.89 16.01,88.66 59.63,88.66 摄像头信号转接.2
RXING3: length 131.1
  Bottom Layer w0.5: H1.15 20.19,37.73 3.84,54.08 3.84,75.64 16.26,88.06 57.73,88.06 摄像头信号转接.3
$1N2300: length 4.5
  Bottom Layer w0.5: U4.1 44.58,70.58 44.58,71.27
$1N4756: length 4
  Bottom Layer w0.5: U1.1 36.72,33.22 R1.2
$1N4785: length 4
  Bottom Layer w0.5: U2.1 36.72,48.59 R2.2
$1N4814: length 4.2
  Bottom Layer w0.5: R3.2 36.72,64.08 U3.1
$1N6717: length 4
  Bottom Layer w0.5: R5.2 44.58,39.72 U5.1
$1N6755: length 4.2
  Bottom Layer w0.5: U6.1 44.58,55.34 R6.2

## Copper pours and planes (outline as drawn; the poured copper is in the pictures)
GND on Top Layer: 0,90 90,90 90,0 0,0
GND on Bottom Layer: 0,90 90,90 90,0 0,0

Small or netless copper shapes (teardrops, artwork), in the pictures only: 88 on Top Layer, 61 on Bottom Layer

## Text on the board
Top Silkscreen Layer: PWM3 | PWM2 | PWM1 | RX3 | CS | RX2 | RX1 | HW3 | HW2 | HW1 | GND | 3V3 | 5V2 | 5V | 5 | 6 | 4 | 3 | 2 | 1 | 浙江师范大学行知学院 / 2023装配机器人_转接板
